# Altium schematic sheet Power.SchDoc
size 420 x 297 mm; SheetNumber: 2; SheetTotal: 2
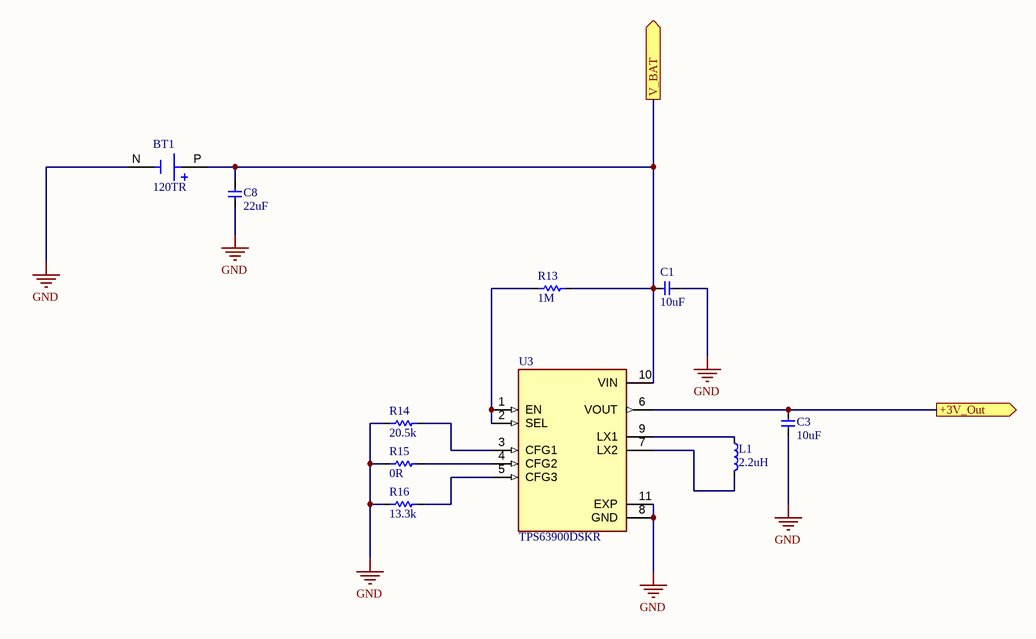
[diagram p0: Power.SchDoc]

## Parts
BT1  120TR  [BAT_120TR]
C1  10uF  [Cap-0402]
C3  10uF  [Cap-0402]
C8  22uF  [Cap-0402]
L1  2.2uH  [IND-0806]
R13  1M  [Res-0201]
R14  20.5k  [Res-0201]
R15  0R  [Res-0201]
R16  13.3k  [Res-0201]
U3  TPS63900DSKR  [IC_TPS63900DSKR]

## Ports
+3V_Out (out, see MCU[2B]), V_BAT (out, see MCU[4A])

## Nets
GND: BT1.N(NEG) C1.1 C3.1 C8.1 R14.1 R15.1 R16.1 U3.8(GND) U3.11(EXP)
+3V_Out: C3.2 U3.6(VOUT) ; port +3V_Out
V_BAT: BT1.P(POS) C1.2 C8.2 R13.2 U3.10(VIN) ; port V_BAT
NetL1_1: L1.1 U3.9(LX1)
NetL1_2: L1.2 U3.7(LX2)
NetR13_1: R13.1 U3.1(EN) U3.2(SEL)
NetR14_2: R14.2 U3.3(CFG1)
NetR15_2: R15.2 U3.4(CFG2)
NetR16_2: R16.2 U3.5(CFG3)

## Notes on the sheet
- File:
- Title:
- Date:
- Page
- Num:
- Total:
- Drawn By: Huzaifa Ali

## Library data of the parts
BT1 = 120TR: Manufacturer: Keystone; Manufacturer Part Number: 120TR; JLCPCB Part Number: C5354946; Supplier: JLCPCB; MP: 120TR; Availability: Unavailable
C1 C3 = CL05A106MP5NUNC: CAP CER 10UF 10V X5R 0402; Manufacturer: Samsung; Tolerance: 20%; Item Type: Capacitor; Supplier 1: Avnet; Manufacturer Part Number: CL05A106MP5NUNC; RoHS: Yes; Category: Ceramic Capacitors; Stock 1: 1729850; Pricing 1: 10000=0.02537 (USD); Mount: Surface Mount; Case/Package: 0402; Case Code (Metric): 1005; Case Code (Imperial): 0402; Contact Plating: Tin; Min Operating Temperature: -55°C; Max Operating Temperature: 85°C; Package Quantity: 1; Packaging: Tape and Reel; Capacitance: 10uF; Voltage Rating: 10V; Dielectric: X5R; Termination: Wraparound; Series: CL; Construction: Flat; Length: 1mm; Width: 0.02inch; Thickness: 0.028inch; Depth: 0.5mm; Radiation Hardening: No; Lead Free: Lead Free; RoHS Compliant: Yes; ComponentLink1URL: https://datasheet.ciiva.com/25721/cl05a106mp5nunc-25721584.pdf?src-supplier=Digi-Key; ComponentLink1Description: https://datasheet.ciiva.com/25721/cl05a106mp5nunc-25721584.pdf?src-supplier=Digi-Key; ComponentLink2URL: https://datasheet.ciiva.com/26838/getdatasheetpartid-745310-26838170.pdf?src-supplier=Verical; ComponentLink2Description: https://datasheet.ciiva.com/26838/getdatasheetpartid-745310-26838170.pdf?src-supplier=Verical; Supplier Part Number 1: CL05A106MP5NUNC; LCSC Part Number: C315248
C8 = GRM158R61A226ME15D: CAP CER 22UF 10V X5R 0402; Manufacturer: Murata; Material: 4241ConductorMaterial; Dielectric: 1537DielectricType; Tolerance: 20%; Item Type: Capacitor; Supplier: Mouser; Supplier Part Number: 81-GRM158R61A226ME5D; Manufacturer Part Number: GRM158R61A226ME15D; RoHS: Yes; Stock: 328944; Pricing: 1=0.46, 10=0.225, 50=0.225, 100=0.146, 1000=0.124, 10000=0.106 (USD); Case/Package: 343Case; Min Operating Temperature: -55°C; Max Operating Temperature: 85°C; Value: 22uF; Voltage Rating: 10V; Voltage Rating (DC): 10V; Length: 1mm; Width: 500um; Height: 800um; Thickness: 800um; LCSC Part Number: C3845593; Category: Ceramic Capacitors
L1 = DFE201612E-2R2M=P2: FIXED IND 2.2UH 1.8A 116MOHM SMD; Manufacturer: Murata; Item Type: Inductors; Inductance Tolerance: 20%; Saturation Current: 2.4A; ESR: 116mR; Test Frequency: 1MHz; Supplier: Mouser; LCSC Part Number: C337893; Manufacturer Part Number: DFE201612E-2R2M=P2; RoHS: Yes; Stock: 140327; Pricing: 1=0.31, 10=0.202, 50=0.202, 100=0.158, 1000=0.145, 10000=0.104 (USD); Min Operating Temperature: -40°C; Max Operating Temperature: 125°C; Current Rating: 1.8A; Value: 2.2uH; Packaging: 13Packaging; RMS Current (Irms): 1.8A; Height: 1.2mm; ComponentLink1URL: http://www.farnell.com/datasheets/2339714.pdf?src-supplier=Farnell; ComponentLink1Description: http://www.farnell.com/datasheets/2339714.pdf?src-supplier=Farnell; ComponentLink2URL: https://search.murata.co.jp/Ceramy/image/img/P02/J(E)TE243A-0006.pdf?src-supplier=Digikey; ComponentLink2Description: https://search.murata.co.jp/Ceramy/image/img/P02/J(E)TE243A-0006.pdf?src-supplier=Digikey; ComponentLink3URL: http://www.farnell.com/datasheets/2339714.pdf?src-supplier=Newark; ComponentLink3Description: http://www.farnell.com/datasheets/2339714.pdf?src-supplier=Newark; ComponentLink4URL: https://datasheet.octopart.com/DFE201612E-2R2M%3DP2-Murata-datasheet-150582460.pdf?src-supplier=Arrow.cn; ComponentLink4Description: https://datasheet.octopart.com/DFE201612E-2R2M%3DP2-Murata-datasheet-150582460.pdf?src-supplier=Arrow.cn
R13 = 0201WMD1003TEE: -55℃~+155℃ 1MΩ 25V 50mW Thick Film Resistor ±200ppm/℃ ±5% 0201 Chip Resistor - Surface Mount ROHS; Manufacturer: YAGEO; Manufacturer Part Number: AF0201JR-071ML; Package: 0201; LCSC Part Number: C144007; Item Type: Resistor; ComponentLink1Description: LCSC; ComponentLink1URL: https://www.lcsc.com/product-detail/Chip-Resistor-Surface-Mount_UNI-ROYAL-Uniroyal-Elec-0201WMD1003TEE_C778396.html
R14 = 0201WMD1003TEE: 20.5kΩ 50mW Thick Film Resistor ±1% ±200ppm/℃ 0201 Chip Resistor - Surface Mount RoHS; Manufacturer: YAGEO; Manufacturer Part Number: AC0201FR-0720K5L; Package: 0201; LCSC Part Number: C226462; Item Type: Resistor; ComponentLink1Description: LCSC; ComponentLink1URL: https://www.lcsc.com/product-detail/Chip-Resistor-Surface-Mount_UNI-ROYAL-Uniroyal-Elec-0201WMD1003TEE_C778396.html
R15 = 0201WMD1003TEE: -55℃~+125℃ 0Ω 25V 50mW Thick Film Resistor ±1% 0201 Chip Resistor - Surface Mount ROHS; Manufacturer: YAGEO; Manufacturer Part Number: RC0201FR-070RL; Package: 0201; LCSC Part Number: C106227; Item Type: Resistor; ComponentLink1Description: LCSC; ComponentLink1URL: https://www.lcsc.com/product-detail/Chip-Resistor-Surface-Mount_UNI-ROYAL-Uniroyal-Elec-0201WMD1003TEE_C778396.html
R16 = 0201WMD1003TEE: -55℃~+155℃ 13.3kΩ 25V 50mW Thick Film Resistor ±1% ±200ppm/℃ 0201 Chip Resistor - Surface Mount ROHS; Manufacturer: UNI-ROYAL(Uniroyal Elec); Manufacturer Part Number: 0201WMF1332TEE; Package: 0201; LCSC Part Number: C423749; Item Type: Resistor; ComponentLink1Description: LCSC; ComponentLink1URL: https://www.lcsc.com/product-detail/Chip-Resistor-Surface-Mount_UNI-ROYAL-Uniroyal-Elec-0201WMD1003TEE_C778396.html
U3 = TPS63900DSKR: 1.8-V to 5.5-V, 75-nA IQ buck-boost converter with input current limit and Dynamic Voltage Scaling; Manufacturer: Texas Instruments; SnapEDA_Link: https://www.snapeda.com/parts/TPS63900DSKR/Texas+Instruments/view-part/?ref=snap; Package: WSON-10 Texas Instruments; Value: *; Manufacturer Part Number: TPS63900DSKR; LCSC Part Number: C1518762